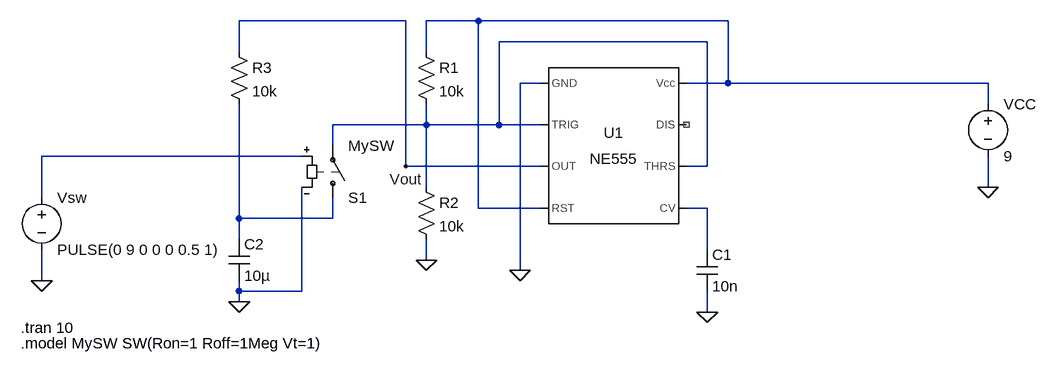
[diagram p0: schematic 555_Toggle_Latch.asc]
555_Toggle_Latch.asc, the LTspice schematic file:
Version 4
SHEET 1 880 680
WIRE -96 0 -352 0
WIRE 16 0 -64 0
WIRE 400 0 16 0
WIRE 368 32 48 32
WIRE -352 48 -352 0
WIRE -64 48 -64 0
WIRE 112 96 80 96
WIRE 400 96 400 0
WIRE 400 96 336 96
WIRE 800 96 400 96
WIRE 800 128 800 96
WIRE -64 160 -64 128
WIRE -64 160 -208 160
WIRE 48 160 48 32
WIRE 48 160 -64 160
WIRE 112 160 48 160
WIRE -208 192 -208 160
WIRE -256 208 -656 208
WIRE -96 224 -96 0
WIRE 112 224 -96 224
WIRE 368 224 368 32
WIRE 368 224 336 224
WIRE -64 256 -64 160
WIRE 800 256 800 208
WIRE -656 272 -656 208
WIRE 16 288 16 0
WIRE 112 288 16 288
WIRE 368 288 336 288
WIRE -352 304 -352 128
WIRE -208 304 -208 272
WIRE -208 304 -352 304
WIRE -352 336 -352 304
WIRE 368 352 368 288
WIRE -64 368 -64 336
WIRE 80 384 80 96
WIRE -656 400 -656 352
WIRE -352 416 -352 400
WIRE -256 416 -256 256
WIRE -256 416 -352 416
WIRE -352 432 -352 416
WIRE 368 448 368 416
FLAG 800 256 0
FLAG -656 400 0
FLAG -96 224 Vout
FLAG 80 384 0
FLAG 368 448 0
FLAG -64 368 0
FLAG -352 432 0
SYMBOL Misc\\NE555 224 192 R0
SYMATTR InstName U1
SYMBOL voltage 800 112 R0
WINDOW 123 0 0 Left 0
WINDOW 39 0 0 Left 0
SYMATTR InstName VCC
SYMATTR Value 9
SYMBOL cap 352 352 R0
SYMATTR InstName C1
SYMATTR Value 10n
SYMBOL voltage -656 256 R0
WINDOW 123 0 0 Left 0
WINDOW 39 0 0 Left 0
SYMATTR InstName Vsw
SYMATTR Value PULSE(0 9 0 0 0 0.5 1)
SYMBOL res -80 32 R0
SYMATTR InstName R1
SYMATTR Value 10k
SYMBOL res -80 240 R0
SYMATTR InstName R2
SYMATTR Value 10k
SYMBOL cap -368 336 R0
SYMATTR InstName C2
SYMATTR Value 10µ
SYMBOL res -368 32 R0
SYMATTR InstName R3
SYMATTR Value 10k
SYMBOL sw -208 288 M180
SYMATTR InstName S1
SYMATTR Value MySW
TEXT -688 472 Left 2 !.tran 10
TEXT -688 496 Left 2 !.model MySW SW(Ron=1 Roff=1Meg Vt=1)

The netlist it stands for:
* 555_Toggle_Latch.asc
XU1 0 N002 Vout N001 N004 N002 NC_01 N001 NE555  ; pins GND TRIG OUT RST CV THRS DIS Vcc
VCC N001 0 9
C1 N004 0 10n
Vsw N003 0 PULSE(0 9 0 0 0 0.5 1)
R1 N001 N002 10k
R2 N002 0 10k
C2 N005 0 10µ
R3 Vout N005 10k
S1 N005 N002 N003 0 MySW
.tran 10
.model MySW SW(Ron=1 Roff=1Meg Vt=1)
.lib NE555.sub
.backanno
.end